# Altium schematic sheet RTDSubsheet.SchDoc
size A4; SheetNumber: 5; SheetTotal: 5
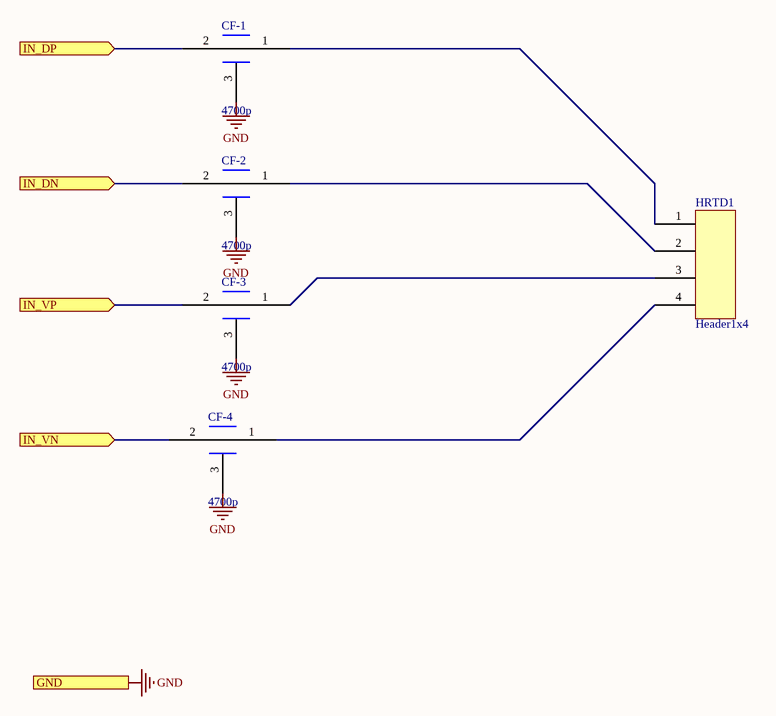
[diagram p0: RTDSubsheet.SchDoc]

## Parts
CF-1  4700p  [0402-Passthrough]
CF-2  4700p  [0402-Passthrough]
CF-3  4700p  [0402-Passthrough]
CF-4  4700p  [0402-Passthrough]
HRTD1  Header1x4  [Header4x1Small]

## Ports
GND (in), IN_DN (in), IN_DP (in), IN_VN (in), IN_VP (in)

## Nets
GND: CF-1.3 CF-2.3 CF-3.3 CF-4.3 ; port GND
IN_DN: CF-2.2 ; port IN_DN
IN_DP: CF-1.2 ; port IN_DP
IN_VN: CF-4.2 ; port IN_VN
IN_VP: CF-3.2 ; port IN_VP
NetCF-1_1: CF-1.1 HRTD1.1
NetCF-2_1: CF-2.1 HRTD1.2
NetCF-3_1: CF-3.1 HRTD1.3
NetCF-4_1: CF-4.1 HRTD1.4

## Library data of the parts
CF-1-CF-4 = CapFeedthrough: Digikey P/N: 709-EMCF500W472M1GV001TCT-ND
HRTD1 = Header1x4: Digikey P/N: ED10563-ND